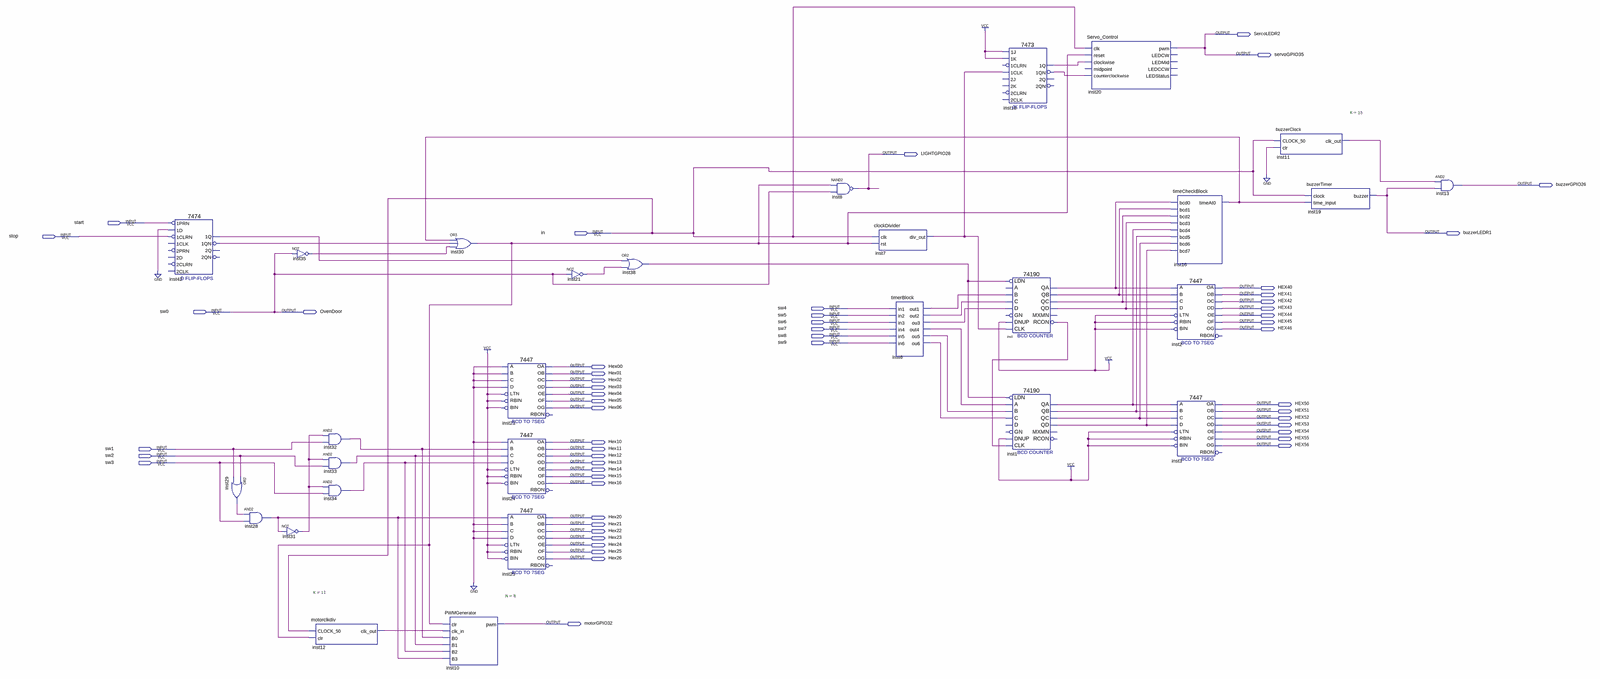
[diagram p0: schematic sheet, whole]
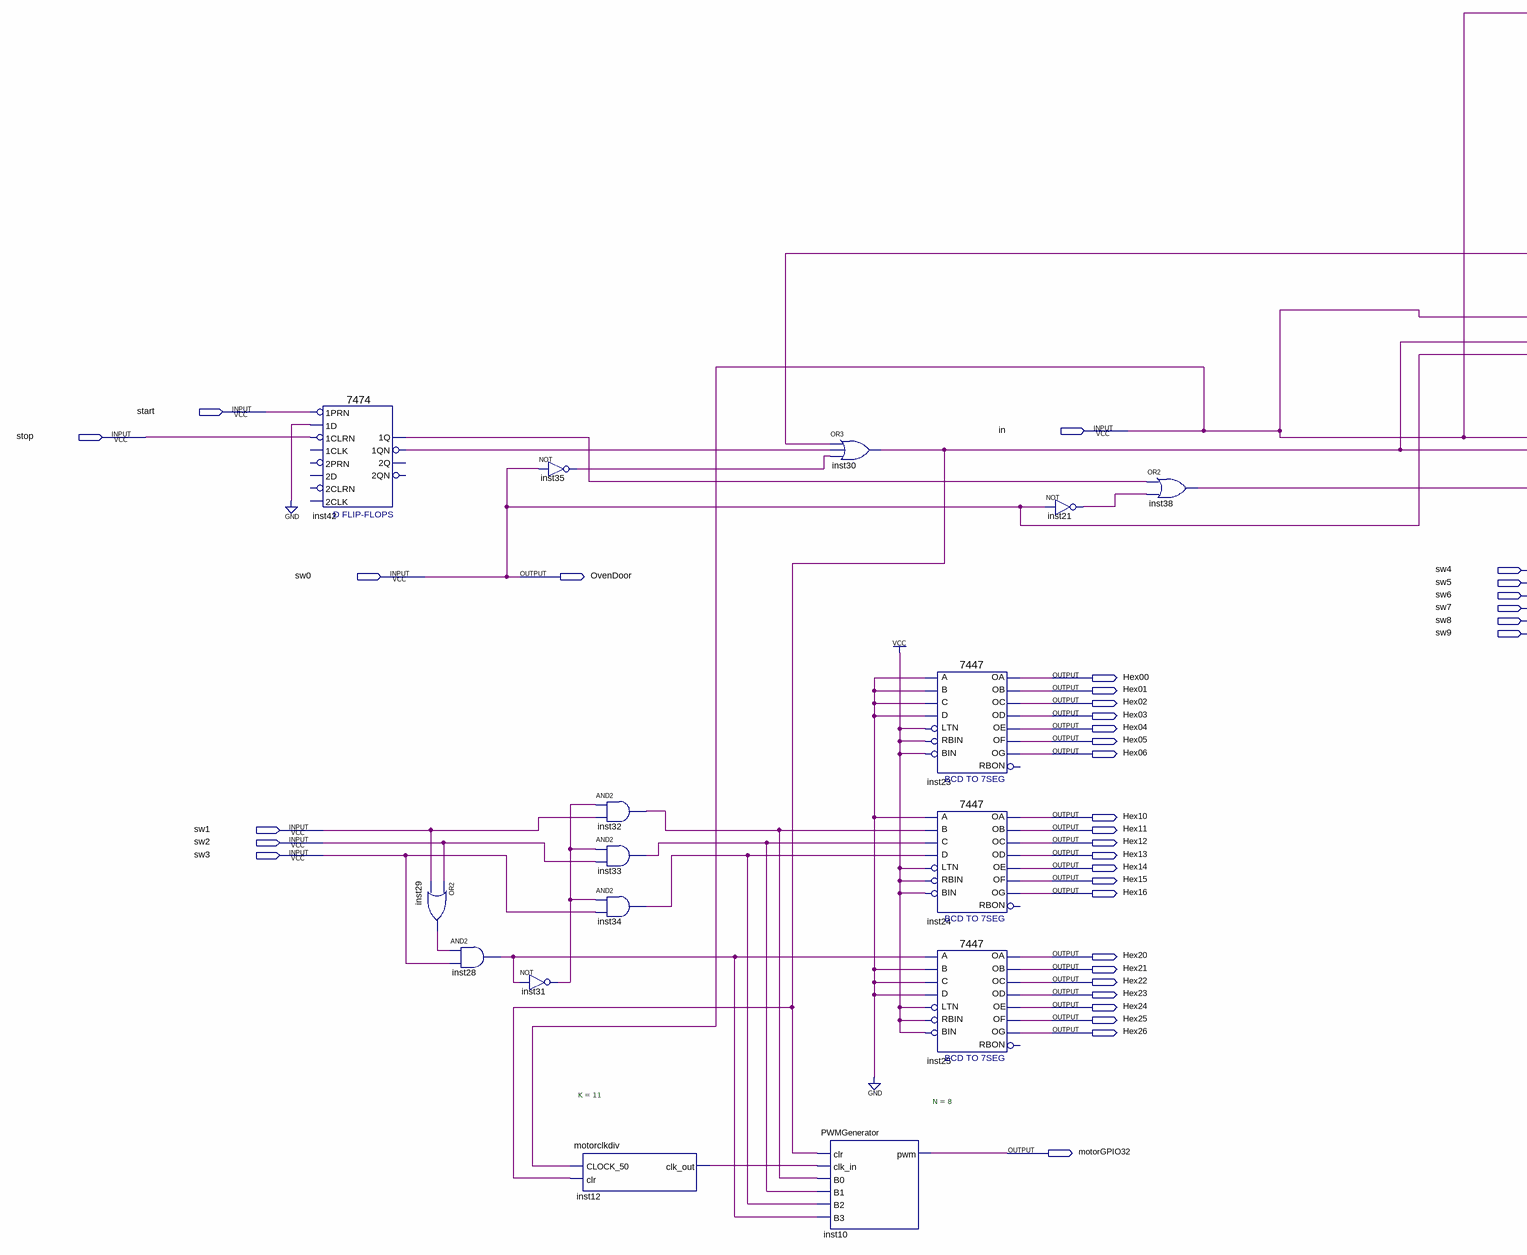
[diagram p1: schematic sheet, left part]
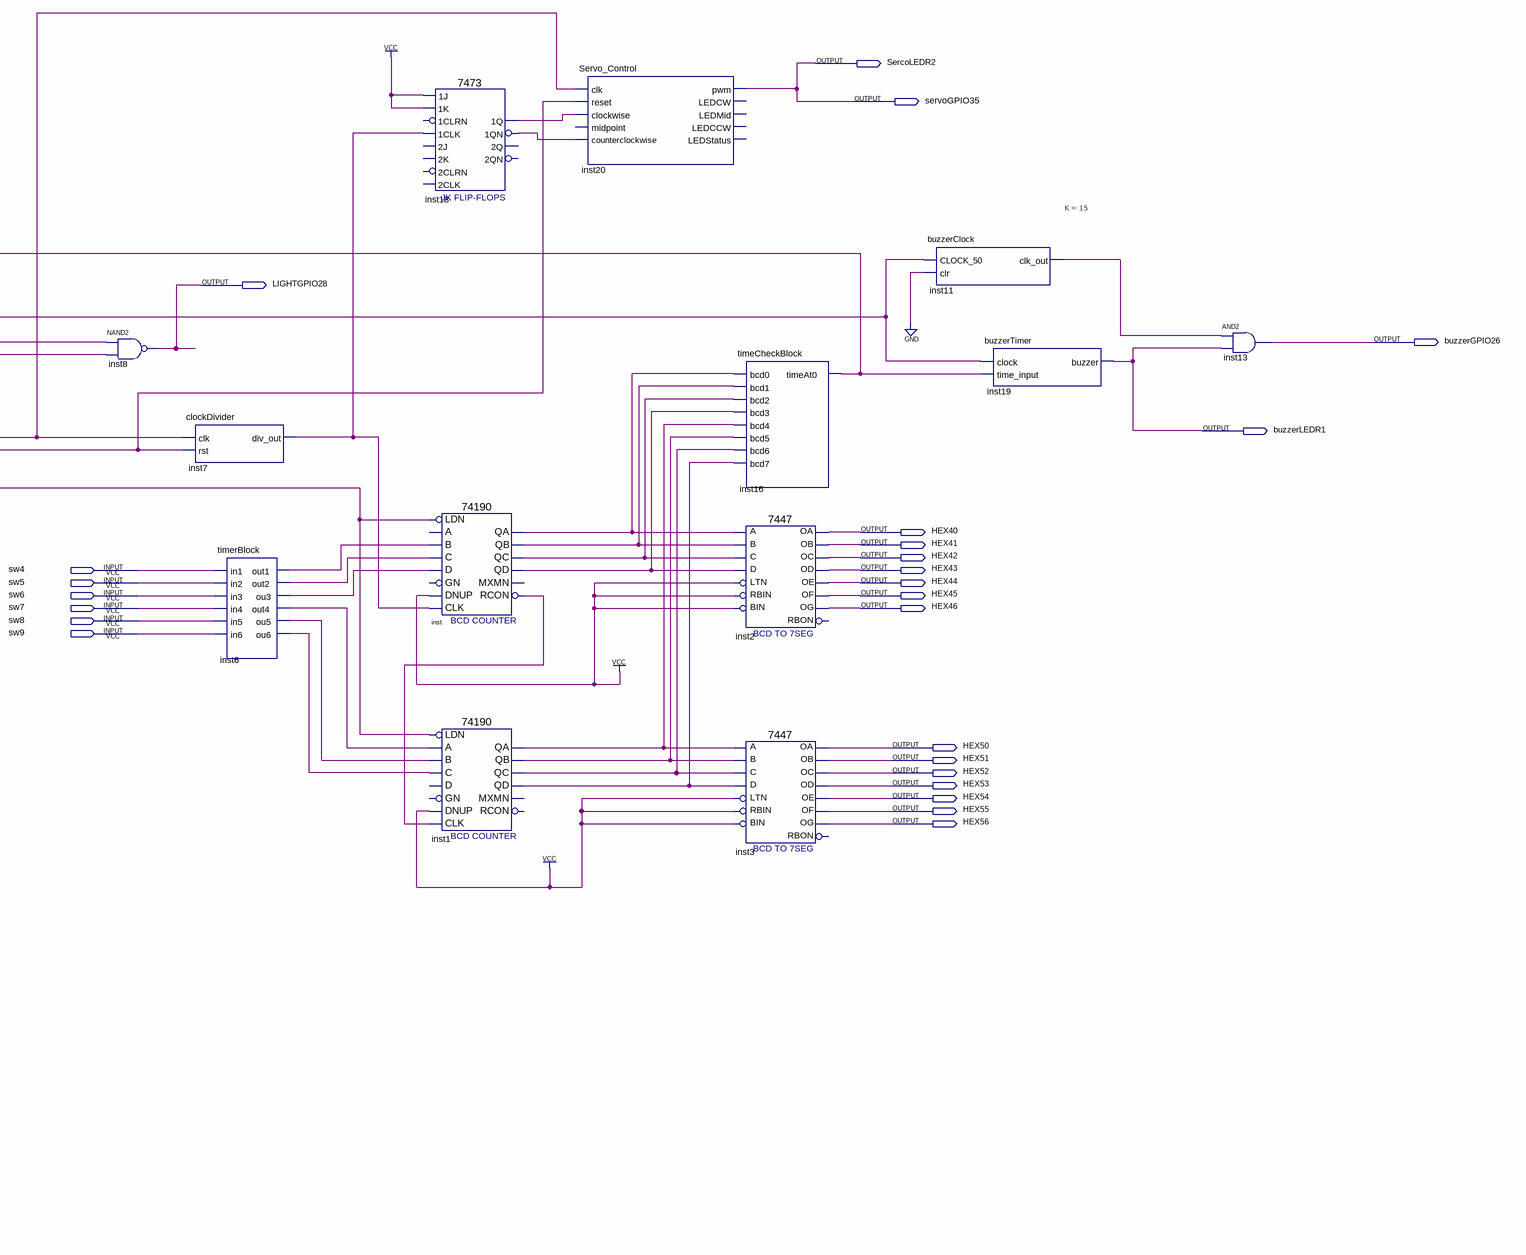
[diagram p2: schematic sheet, right part]
// Quartus schematic microwaveFinalProjectTESTINGFILE.bdf as structural Verilog: 29 symbols, 55 pins
module microwaveFinalProjectTESTINGFILE (
  input  start,
  input  in,
  input  stop,
  input  sw4,
  input  sw0,
  input  sw5,
  input  sw6,
  input  sw7,
  input  sw8,
  input  sw9,
  input  sw1,
  input  sw2,
  input  sw3,
  output SercoLEDR2,
  output servoGPIO35,
  output LIGHTGPIO28,
  output buzzerGPIO26,
  output buzzerLEDR1,
  output HEX40,
  output HEX41,
  output HEX42,
  output HEX43,
  output OvenDoor,
  output HEX44,
  output HEX45,
  output HEX46,
  output Hex00,
  output Hex01,
  output Hex02,
  output Hex03,
  output Hex04,
  output Hex05,
  output HEX50,
  output Hex06,
  output HEX51,
  output HEX52,
  output HEX53,
  output HEX54,
  output HEX55,
  output Hex10,
  output HEX56,
  output Hex11,
  output Hex12,
  output Hex13,
  output Hex14,
  output Hex15,
  output Hex16,
  output Hex20,
  output Hex21,
  output Hex22,
  output Hex23,
  output Hex24,
  output Hex25,
  output Hex26,
  output motorGPIO32
);

  wire inst1_qa, inst1_qb, inst1_qc, inst1_qd, inst6_ou3, inst6_ou5, inst6_ou6, inst6_out1, inst6_out2,
       inst6_out4, inst7_div_out, inst11_clk_out, inst12_clk_out, inst16_timeat0, inst18_1q, inst18_1qn,
       inst21_out, inst28_out, inst29_out, inst30_out, inst31_out, inst32_out, inst33_out, inst34_out,
       inst35_out, inst38_out, inst42_1q, inst42_1qn, inst_qa, inst_qb, inst_qc, inst_qd, inst_rcon;

  \7474  inst42 (
    .\1D (1'b0), .\1PRN (start), .\1CLRN (stop), .\1QN (inst42_1qn), .\1Q (inst42_1q));  // open: 2D, 2PRN, 1CLK, 2CLK, 2CLRN, 2Q, 2QN
  or inst29 (inst29_out, sw2, sw1);
  and inst28 (inst28_out, inst29_out, sw3);
  not inst31 (inst31_out, inst28_out);
  not inst35 (inst35_out, sw0);
  motorclkdiv #(.K(11)) inst12 (.CLOCK_50(in), .clr(inst30_out), .clk_out(inst12_clk_out));
  and inst32 (inst32_out, inst31_out, sw1);
  and inst33 (inst33_out, inst31_out, sw2);
  and inst34 (inst34_out, inst31_out, sw3);
  or inst30 (inst30_out, inst16_timeat0, inst42_1qn, inst35_out);
  PWMGenerator #(.N(8)) inst10 (
    .clr(inst30_out), .clk_in(inst12_clk_out), .B0(inst32_out), .B1(inst33_out), .B2(inst34_out),
    .B3(inst28_out), .pwm(motorGPIO32));
  \7447  inst23 (
    .LTN(1'b1), .B(1'b0), .C(1'b0), .D(1'b0), .RBIN(1'b1), .BIN(1'b1), .A(1'b0), .OB(Hex01), .OC(Hex02),
    .OE(Hex04), .OD(Hex03), .OF(Hex05), .OG(Hex06), .OA(Hex00));  // open: RBON
  \7447  inst24 (
    .LTN(1'b1), .B(inst32_out), .C(inst33_out), .D(inst34_out), .RBIN(1'b1), .BIN(1'b1), .A(1'b0),
    .OB(Hex11), .OC(Hex12), .OE(Hex14), .OD(Hex13), .OF(Hex15), .OG(Hex16), .OA(Hex10));  // open: RBON
  \7447  inst25 (
    .LTN(1'b1), .B(1'b0), .C(1'b0), .D(1'b0), .RBIN(1'b1), .BIN(1'b1), .A(inst28_out), .OB(Hex21),
    .OC(Hex22), .OE(Hex24), .OD(Hex23), .OF(Hex25), .OG(Hex26), .OA(Hex20));  // open: RBON
  not inst21 (inst21_out, sw0);
  or inst38 (inst38_out, inst42_1q, inst21_out);
  nand inst8 (LIGHTGPIO28, inst30_out, sw0);
  clockDivider inst7 (.clk(in), .rst(inst30_out), .div_out(inst7_div_out));
  timerBlock inst6 (
    .in1(sw4), .in2(sw5), .in3(sw6), .in4(sw7), .in5(sw8), .in6(sw9), .out1(inst6_out1), .out2(inst6_out2),
    .ou3(inst6_ou3), .out4(inst6_out4), .ou5(inst6_ou5), .ou6(inst6_ou6));
  \7473  inst18 (
    .\1J (1'b1), .\1K (1'b1), .\1CLK (inst7_div_out), .\1QN (inst18_1qn), .\1Q (inst18_1q));  // open: 1CLRN, 2J, 2CLK, 2CLRN, 2K, 2Q, 2QN
  \74190  inst (
    .LDN(inst38_out), .C(inst6_out2), .B(inst6_out1), .D(inst6_ou3), .CLK(inst7_div_out), .DNUP(1'b1),
    .QA(inst_qa), .QB(inst_qb), .QD(inst_qd), .QC(inst_qc), .RCON(inst_rcon));  // open: A, GN, MXMN
  \74190  inst1 (
    .LDN(inst38_out), .A(inst6_out4), .C(inst6_ou6), .B(inst6_ou5), .CLK(inst_rcon), .DNUP(1'b1),
    .QA(inst1_qa), .QB(inst1_qb), .QD(inst1_qd), .QC(inst1_qc));  // open: D, GN, MXMN, RCON
  Servo_Control inst20 (
    .clk(in), .reset(inst30_out), .clockwise(inst18_1q), .counterclockwise(inst18_1qn), .pwm(SercoLEDR2));  // open: midpoint, LEDCW, LEDMid, LEDCCW, LEDStatus
  timeCheckBlock inst16 (
    .bcd0(inst_qa), .bcd1(inst_qb), .bcd2(inst_qc), .bcd3(inst_qd), .bcd4(inst1_qa), .bcd5(inst1_qb),
    .bcd6(inst1_qc), .bcd7(inst1_qd), .timeAt0(inst16_timeat0));
  \7447  inst2 (
    .LTN(1'b1), .B(inst_qb), .C(inst_qc), .D(inst_qd), .RBIN(1'b1), .BIN(1'b1), .A(inst_qa), .OB(HEX41),
    .OC(HEX42), .OE(HEX44), .OD(HEX43), .OF(HEX45), .OG(HEX46), .OA(HEX40));  // open: RBON
  \7447  inst3 (
    .LTN(1'b1), .B(inst1_qb), .C(inst1_qc), .D(inst1_qd), .RBIN(1'b1), .BIN(1'b1), .A(inst1_qa), .OB(HEX51),
    .OC(HEX52), .OE(HEX54), .OD(HEX53), .OF(HEX55), .OG(HEX56), .OA(HEX50));  // open: RBON
  buzzerClock #(.K(15)) inst11 (.CLOCK_50(in), .clr(1'b0), .clk_out(inst11_clk_out));
  buzzerTimer inst19 (.clock(in), .time_input(inst16_timeat0), .buzzer(buzzerLEDR1));
  and inst13 (buzzerGPIO26, inst11_clk_out, buzzerLEDR1);

  assign OvenDoor = sw0;
  assign servoGPIO35 = SercoLEDR2;
endmodule
